# Altium schematic sheet 02_MCU_CORE.SchDoc
size A3; SheetNumber: 2; SheetTotal: 7
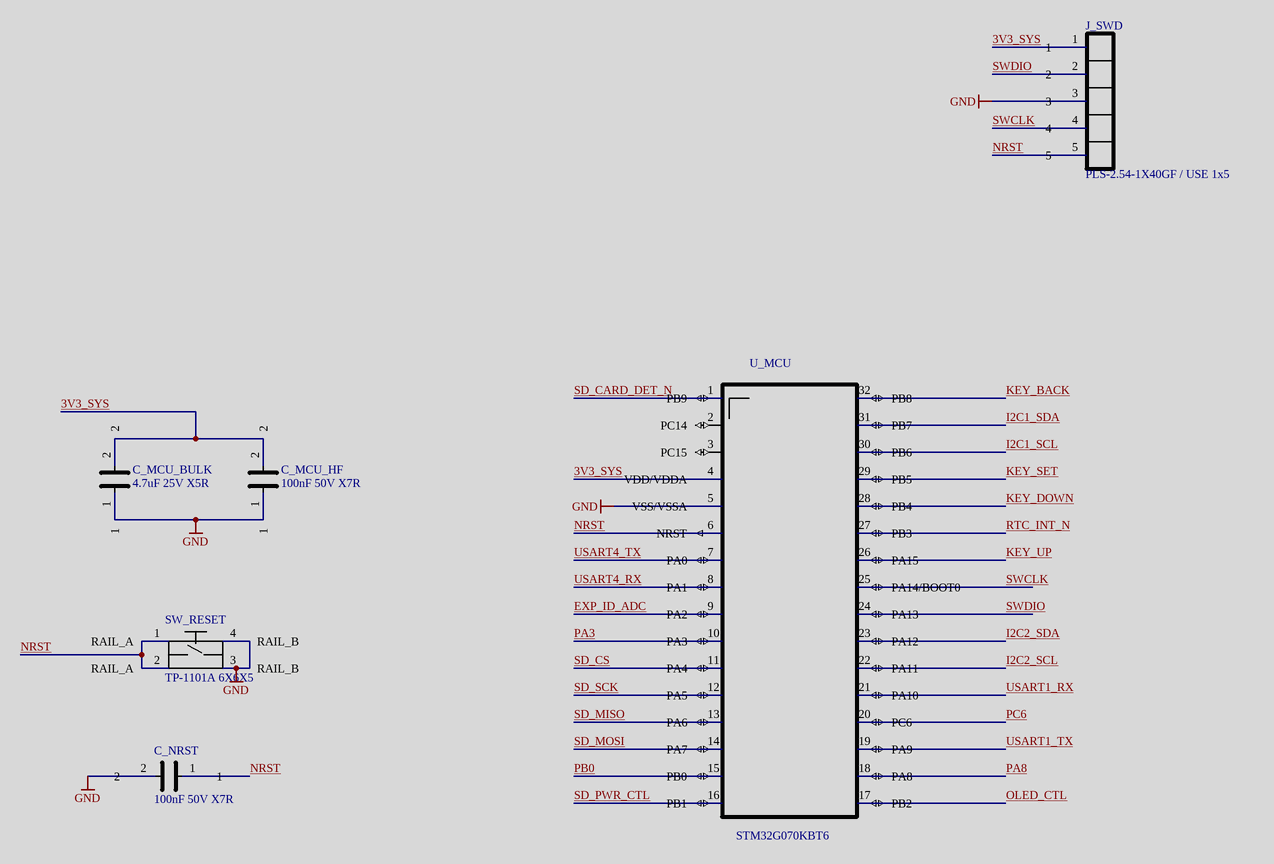
[diagram p0: 02_MCU_CORE.SchDoc]

## Parts
C_MCU_BULK  4.7uF 25V X5R  [TDK_C2012_0805_REFLOW_2P]
C_MCU_HF  100nF 50V X7R  [SAMSUNG_CL10_0603_CAP_2P]
C_NRST  100nF 50V X7R  [SAMSUNG_CL10_0603_CAP_2P]
J_SWD  PLS-2.54-1X40GF / USE 1x5  [GOSUN_PLS_2P54_1X5_THT]
SW_RESET  TP-1101A 6X6X5  [TACT_6X6_H5_P6P5_X4P5_4P_THT_REV_A]
U_MCU  STM32G070KBT6  [ST_LQFP32_7X7_P0P8_32P]

## Nets
GND: C_MCU_BULK.1 C_MCU_HF.1 C_NRST.2 J_SWD.3 SW_RESET.3(RAIL_B) SW_RESET.4(RAIL_B) U_MCU.5(VSS/VSSA)
3V3_SYS: C_MCU_BULK.2 C_MCU_HF.2 J_SWD.1 U_MCU.4(VDD/VDDA)
EXP_ID_ADC: U_MCU.9(PA2)
I2C1_SCL: U_MCU.30(PB6)
I2C1_SDA: U_MCU.31(PB7)
I2C2_SCL: U_MCU.22(PA11)
I2C2_SDA: U_MCU.23(PA12)
KEY_BACK: U_MCU.32(PB8)
KEY_DOWN: U_MCU.28(PB4)
KEY_SET: U_MCU.29(PB5)
KEY_UP: U_MCU.26(PA15)
NRST: C_NRST.1 J_SWD.5 SW_RESET.1(RAIL_A) SW_RESET.2(RAIL_A) U_MCU.6(NRST)
OLED_CTL: U_MCU.17(PB2)
PA3: U_MCU.10(PA3)
PA8: U_MCU.18(PA8)
PB0: U_MCU.15(PB0)
PC6: U_MCU.20(PC6)
RTC_INT_N: U_MCU.27(PB3)
SD_CARD_DET_N: U_MCU.1(PB9)
SD_CS: U_MCU.11(PA4)
SD_MISO: U_MCU.13(PA6)
SD_MOSI: U_MCU.14(PA7)
SD_PWR_CTL: U_MCU.16(PB1)
SD_SCK: U_MCU.12(PA5)
SWCLK: J_SWD.4 U_MCU.25(PA14/BOOT0)
SWDIO: J_SWD.2 U_MCU.24(PA13)
USART1_RX: U_MCU.21(PA10)
USART1_TX: U_MCU.19(PA9)
USART4_RX: U_MCU.8(PA1)
USART4_TX: U_MCU.7(PA0)

Not connected (* = marked no-connect by the designer): U_MCU 2(PC14) 3(PC15)

## Library data of the parts
C_MCU_BULK = C2012X5R1E475K125AB: MCU-core ceramic capacitor; Manufacturer: TDK; Source_Baseline: MCU_SCHEMATIC_ENTRY_BASELINE_v2.1_FA.txt; Design_Status: DESIGN_LOCK_MCU_CORE_V2.1_REUSE_G009_PENDING_LINK; Qualification_Status: UNQUALIFIED_PENDING_SAVE_REOPEN_AUDIT; PIN_NUMBER_SOURCE: INTERNAL_CONVENTION; PIN_FUNCTION_SOURCE: MANUFACTURER_DATASHEET; MPN: C2012X5R1E475K125AB; Value: 4.7uF 25V X5R; Package: C2012 / EIA 0805; Datasheet: https://product.tdk.com/en/search/capacitor/ceramic/mlcc/info?part_no=C2012X5R1E475K125AB
C_MCU_HF C_NRST = CL10B104KB8NNNC: MCU-core ceramic capacitor; Manufacturer: Samsung Electro-Mechanics; Source_Baseline: MCU_SCHEMATIC_ENTRY_BASELINE_v2.1_FA.txt; Design_Status: DESIGN_LOCK_MCU_CORE_V2.1_FOOTPRINT_HOLD; Qualification_Status: UNQUALIFIED_PENDING_SAVE_REOPEN_AUDIT; PIN_NUMBER_SOURCE: INTERNAL_CONVENTION; PIN_FUNCTION_SOURCE: MANUFACTURER_DATASHEET; MPN: CL10B104KB8NNNC; Value: 100nF 50V X7R; Package: 0603 / 1608 metric; Datasheet: https://product.samsungsem.com/mlcc/CL10B104KB8NNN.do
J_SWD = PLS-2.54-1X40GF: 1x40 2.54 mm stock strip; five positions used for SWD service header; Manufacturer: NINGBO GOSUN TECHNOLOGY CO.,LTD; Source_Baseline: MCU_SCHEMATIC_ENTRY_BASELINE_v2.1_FA.txt; Design_Status: DESIGN_LOCK_MCU_CORE_V2.1_MECHANICAL_HOLD; Qualification_Status: UNQUALIFIED_PENDING_SAVE_REOPEN_AUDIT; PIN_NUMBER_SOURCE: INTERNAL_CONVENTION; PIN_FUNCTION_SOURCE: MCU_CORE_V2.1_PROJECT_MAPPING; MPN: PLS-2.54-1X40GF; Value: PLS-2.54-1X40GF / USE 1x5; Package: 2.54 mm single-row pin header stock strip; Datasheet: Manufacturer PLS series ordering code; mechanical drawing still controlled HOLD
SW_RESET = TP-1101A_6X6X5_THT: Generic TP-1101A-compatible momentary SPST-NO tactile switch; 6x6x5 mm; four-pin THT; sample fit pending; Manufacturer: MULTISOURCE; MPN: TP-1101A_COMPATIBLE_6X6X5; Value: TACT SWITCH 6X6X5; Source_Baseline: Datalogger Rev-A post-BT2 controlled library, user-confirmed 2026-09-03; Design_Status: T23_CONTROLLED_ADDITIVE_DELTA; Qualification_Status: SAMPLE_FIT_PENDING; PIN_NUMBER_SOURCE: OMRON_B3F_REFERENCE_TOP_VIEW; PIN_FUNCTION_SOURCE: RAIL_A_1_2_RAIL_B_3_4; Package: 6x6x5 mm THT 4-pin; PCB pitch 6.5x4.5 mm; Datasheet: Omron B3F 6x6 THT geometry reference; procurement sample controls final fit
U_MCU = STM32G070KBT6: Main MCU for Datalogger Rev-A; controlled 32-pin package map; Manufacturer: STMicroelectronics; Source_Baseline: MCU_SCHEMATIC_ENTRY_BASELINE_v2.1_FA.txt; Design_Status: DESIGN_LOCK_MCU_CORE_V2.1; Qualification_Status: UNQUALIFIED_PENDING_SAVE_REOPEN_AUDIT; PIN_NUMBER_SOURCE: MANUFACTURER_DATASHEET; MPN: STM32G070KBT6; Value: STM32G070KBT6; Package: LQFP32 7x7 mm P0.8; Datasheet: https://www.st.com/resource/en/datasheet/stm32g070kb.pdf; PIN_FUNCTION_SOURCE: MANUFACTURER_DATASHEET